# Altium schematic sheet QuickSwitchV5.SchDoc
size 420 x 297 mm; SheetNumber: 1; SheetTotal: 1
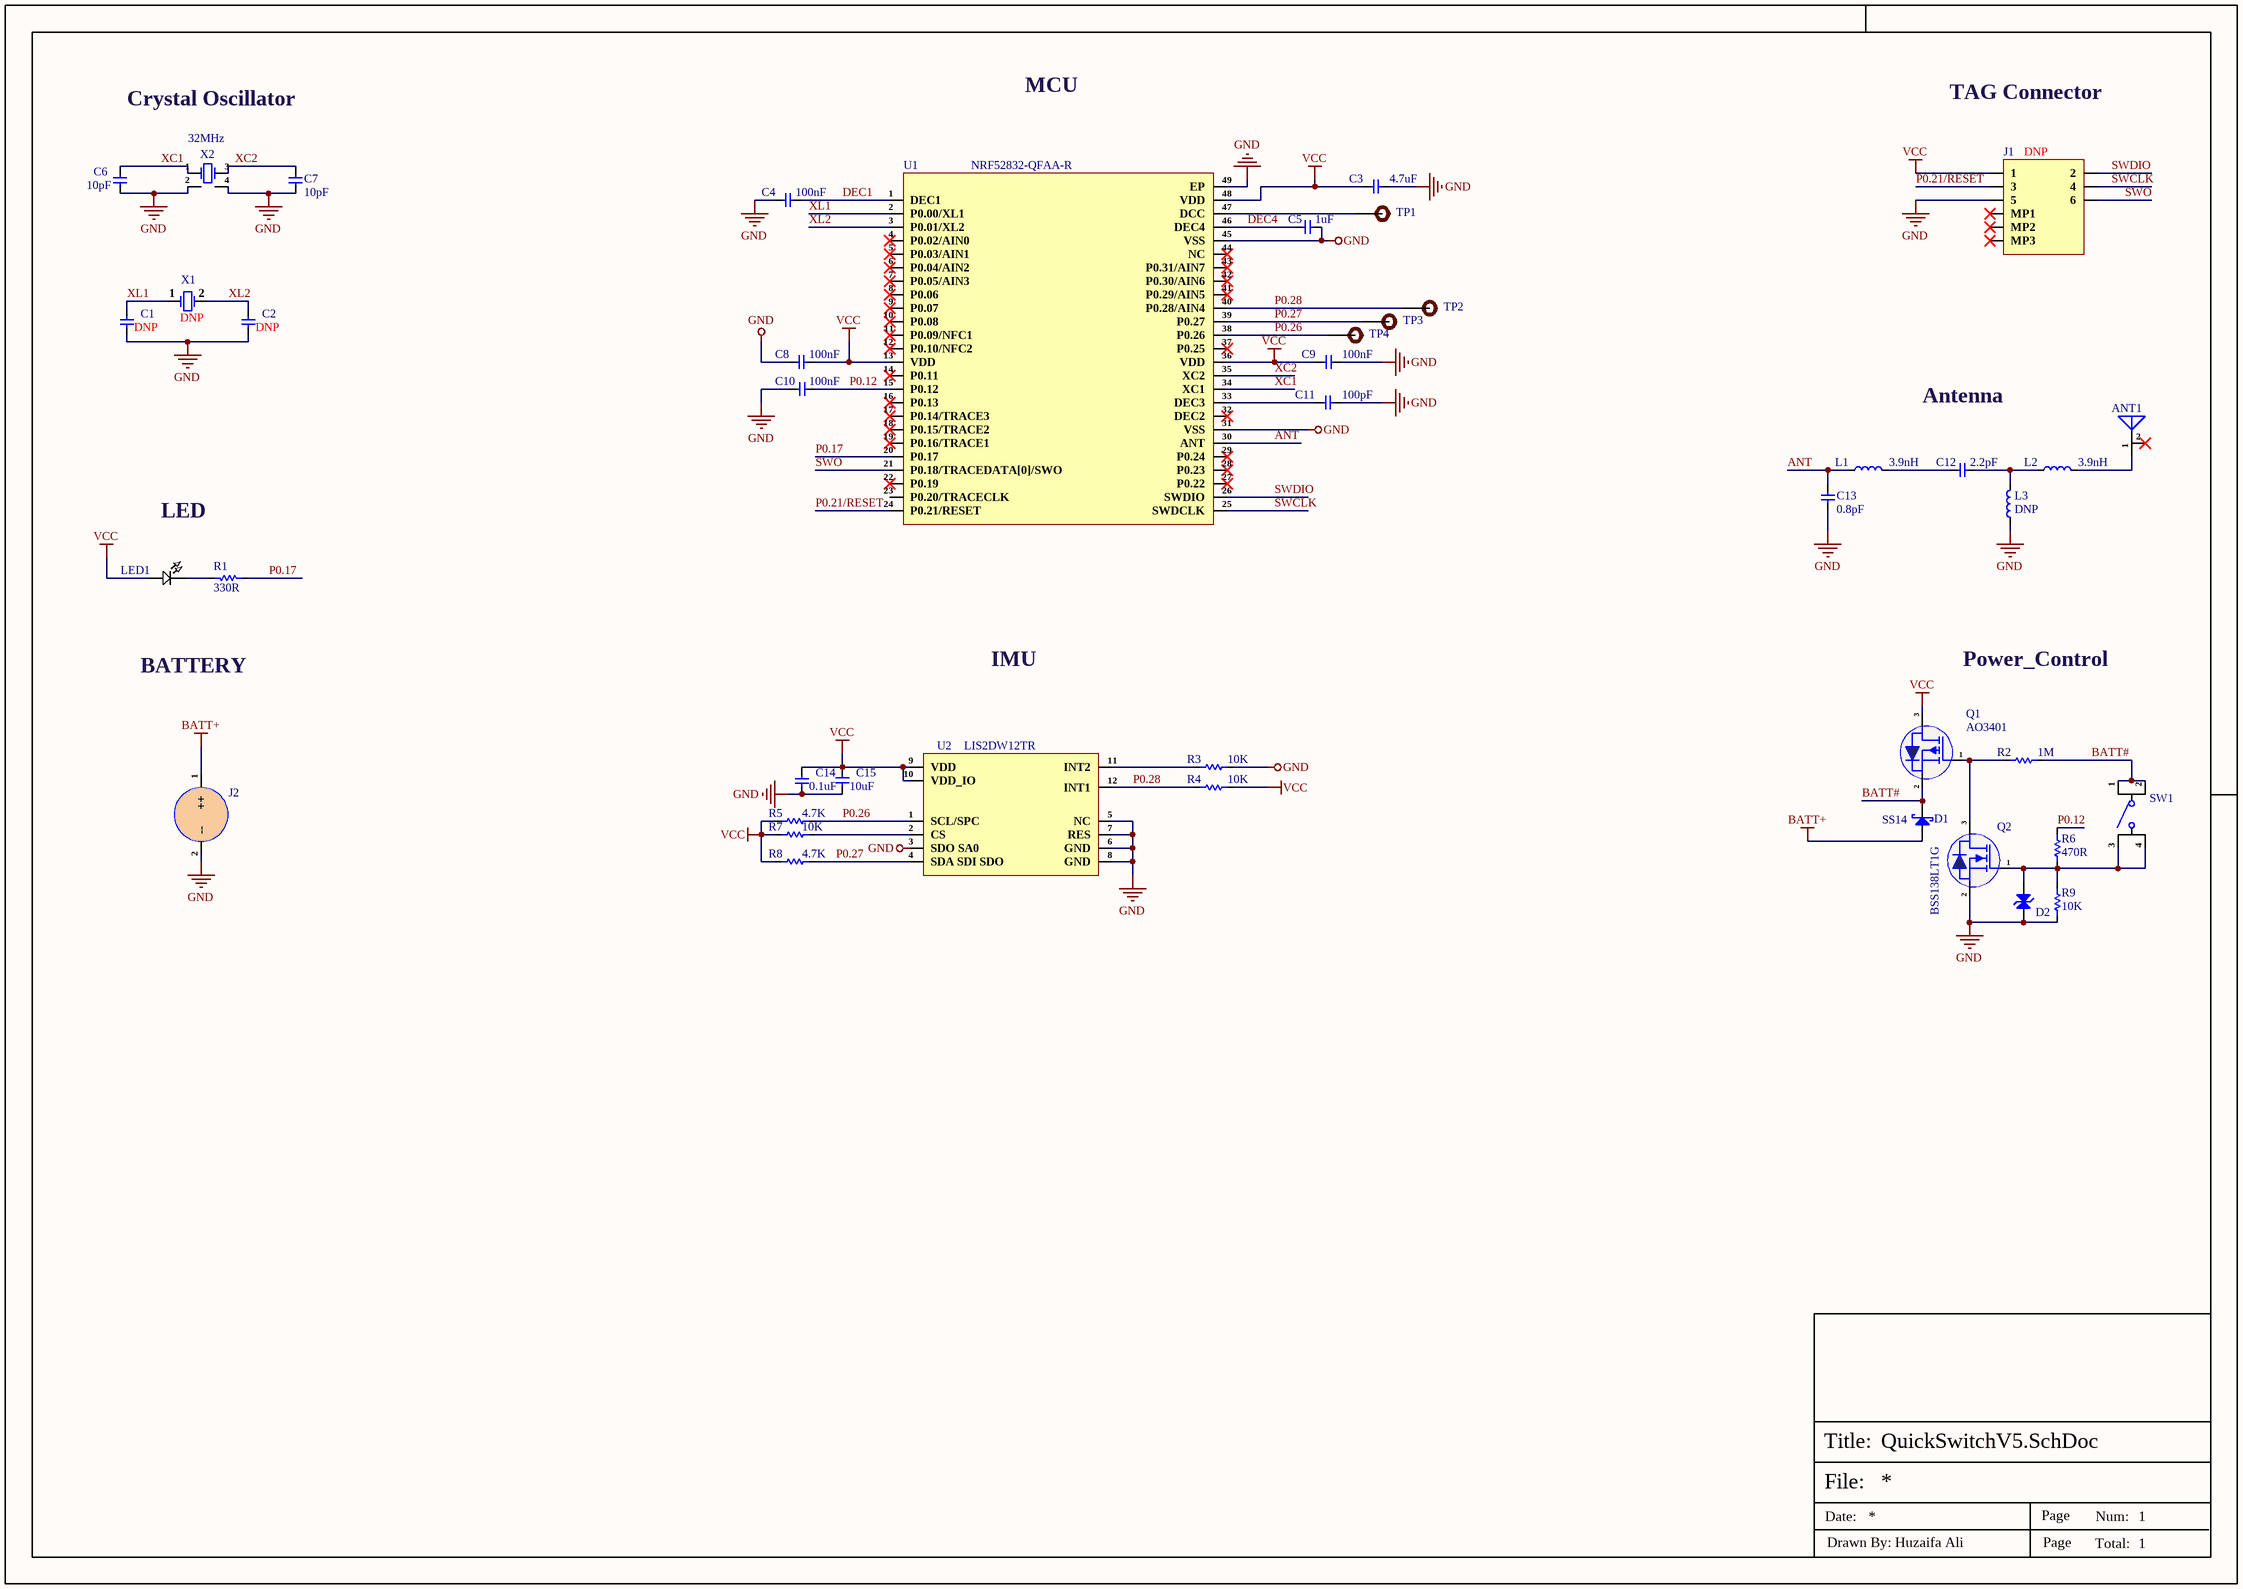
[diagram p0: QuickSwitchV5.SchDoc]

## Parts
ANT1  2450AT18B100E  [ANT-1206]  (value not drawn)
C1  DNP  [Cap-0402]
C2  DNP  [Cap-0402]
C3  4.7uF  [Cap-0603]
C4  100nF  [cap-0402]
C5  1uF  [Cap-0402]
C6  10pF  [Cap-0402]
C7  10pF  [Cap-0402]
C8  100nF  [cap-0402]
C9  100nF  [cap-0402]
C10  100nF  [cap-0402]
C11  100pF  [Cap-0402]
C12  2.2pF  [Cap-0402]
C13  0.8pF  [Cap-0402]
C14  0.1uF  [Cap-0603]
C15  10uF  [Cap-0603]
D1  SS14  [SMA(DO-214AC)]
D2  ESD9B3.3ST5G-ES  [SOD-923.]  (value not drawn)
J1  DNP  [TC2030-IDC-NL_]
J2  CR2032-BS-6-1  [CR2032-BS-6-1]  (value not drawn)
L1  3.9nH  [IND-0201]
L2  3.9nH  [IND-0201]
L3  DNP  [IND-0201]
LED1  XL-1608UBC-04  [LED-0603]  (value not drawn)
Q1  AO3401  [SOT-23]
Q2  BSS138LT1G  [SOT-23]
R1  330R  [Res-0603]
R2  1M  [Res-0603]
R3  10K  [Res-0402]
R4  10K  [Res-0402]
R5  4.7K  [Res-0402]
R6  470R  [Res-0603]
R7  10K  [Res-0402]
R8  4.7K  [Res-0402]
R9  10K  [Res-0402]
SW1  TS-1187A-B-A-B  [TS-1187A-B-A-B]  (value not drawn)
TP1  TEST POINT 0.5mm Dia  [Test-point - 0.5mm]  (value not drawn)  (no BOM)
TP2  TEST POINT 0.5mm Dia  [Test-point - 0.5mm]  (value not drawn)  (no BOM)
TP3  TEST POINT 0.5mm Dia  [Test-point - 0.5mm]  (value not drawn)  (no BOM)
TP4  TEST POINT 0.5mm Dia  [Test-point - 0.5mm]  (value not drawn)  (no BOM)
U1  NRF52832-QFAA-R  [QFN-48-EP(6x6)]
U2  LIS2DW12TR  [12-LGA (2x2)]
X1  DNP  [SMD3215-2P]
X2  32MHz  [SMD2016-4P]

## Nets
BATT+: D1.2(A) J2.1(++)
GND: C1.1 C2.1 C3.1 C4.1 C5.2 C6.1 C7.1 C8.1 C9.1 C10.2 C11.2 C13.1 C14.1 C15.2 D2.1(A) J1.5 J2.2(--) L3.1 Q2.2(S) R3.1 R9.1 U1.31(VSS) U1.45(VSS) U1.49(EP) U2.3(SDO_SA0) U2.5(NC) U2.6(GND) U2.7(RES) U2.8(GND) X2.2(GND) X2.4(GND)
VCC: C3.2 C8.2 C9.2 C14.2 C15.1 J1.1 LED1.1 Q1.3(D) R4.1 R5.1 R7.2 R8.1 U1.13(VDD) U1.36(VDD) U1.48(VDD) U2.9(VDD) U2.10(VDD_IO)
ANT: C13.2 L1.1 U1.30(ANT)
BATT#: D1.1(K) Q1.2(S) R2.2 SW1.1 SW1.2
DEC1: C4.2 U1.1(DEC1)
DEC4: C5.1 U1.46(DEC4)
P0.12: C10.1 R6.2 U1.15(P0.12)
P0.17: R1.1 U1.20(P0.17)
P0.21/RESET: J1.3 U1.24(P0.21/RESET)
P0.26: R5.2 TP4.1 U1.38(P0.26) U2.1(SCL/SPC)
P0.27: R8.2 TP3.1 U1.39(P0.27) U2.4(SDA_SDI_SDO)
P0.28: R4.2 TP2.1 U1.40(P0.28/AIN4) U2.12(INT1)
SWCLK: J1.4 U1.25(SWDCLK)
SWDIO: J1.2 U1.26(SWDIO)
SWO: J1.6 U1.21(P0.18/TRACEDATA[0]/SWO)
XC1: C6.2 U1.34(XC1) X2.1(OSC1)
XC2: C7.2 U1.35(XC2) X2.3(OSC2)
XL1: C1.2 U1.2(P0.00/XL1) X1.1(OSC1)
XL2: C2.2 U1.3(P0.01/XL2) X1.2(OSC2)
NetANT1_1: ANT1.1(FEED) L2.2
NetC11_1: C11.1 U1.33(DEC3)
NetC12_1: C12.1 L1.2
NetC12_2: C12.2 L2.1 L3.2
NetD2_2: D2.2(A) Q2.1(G) R6.1 R9.2 SW1.3 SW1.4
NetLED1_2: LED1.2 R1.2
NetQ1_1: Q1.1(G) Q2.3(D) R2.1
NetR3_2: R3.2 U2.11(INT2)
NetR7_1: R7.1 U2.2(CS)
NetTP1_1: TP1.1 U1.47(DCC)

Not connected (* = marked no-connect by the designer): ANT1 2(NC)*; J1 MP1* MP2* MP3*; U1 4(P0.02/AIN0)* 5(P0.03/AIN1)* 6(P0.04/AIN2)* 7(P0.05/AIN3)* 8(P0.06)* 9(P0.07)* 10(P0.08)* 11(P0.09/NFC1)* 12(P0.10/NFC2)* 14(P0.11)* 16(P0.13)* 17(P0.14/TRACE3)* 18(P0.15/TRACE2)* 19(P0.16/TRACE1)* 22(P0.19)* 23(P0.20/TRACECLK) 27(P0.22)* 28(P0.23)* 29(P0.24)* 32(DEC2)* 37(P0.25)* 41(P0.29/AIN5)* 42(P0.30/AIN6)* 43(P0.31/AIN7)* 44(NC)*

## Notes on the sheet
- Crystal Oscillator
- MCU
- TAG Connector
- Antenna
- LED
- IMU
- Power_Control
- BATTERY
- File:
- Title:
- Date:
- Page
- Num:
- Total:
- Drawn By: Huzaifa Ali

## Library data of the parts
ANT1 = 2450AT18B100E: RF ANT 2.4GHZ CHIP SOLDER SMD; Manufacturer: Johanson; Supplier: Arrow Electronics; Supplier Part Number: 2450AT18B100E; Manufacturer Part Number: 2450AT18B100E; RoHS: Yes; Category: RF Antennas; Stock: 792000; Pricing: 3000=0.3724, 6000=0.3688, 9000=0.3651, 12000=0.3615, 15000=0.3579, 30000=0.3542 (USD); ComponentLink1URL: https://datasheet.ciiva.com/24025/antenna-2450at18b100-242422-24025839.pdf?src-supplier=Mouser; ComponentLink1Description: https://datasheet.ciiva.com/24025/antenna-2450at18b100-242422-24025839.pdf?src-supplier=Mouser; ComponentLink2URL: https://datasheet.ciiva.com/1124/1318299-1124918.pdf?src-supplier=Element14; ComponentLink2Description: https://datasheet.ciiva.com/1124/1318299-1124918.pdf?src-supplier=Element14
C1 C2 = CC0402FRNPO9BN130: CAP CER 13PF 50V C0G/NP0 0402; Manufacturer: Yageo; Item Type: Capacitors; Supplier: Digikey; LCSC Part Number: C541433; Manufacturer Part Number: CC0402FRNPO9BN130; RoHS: No; Pricing: 10000=0.00937 (USD)
C3 = GRM188R61E475KE11D: CAP CER 4.7UF 25V X5R 0603; Manufacturer: Murata; Material: Ceramic; Tolerance: 10%; Supplier 1: Digi-Key; Manufacturer Part Number: GRM188R61E475KE11D; Stock 1: 71618; Pricing 1: 1=0.37, 10=0.258, 100=0.1549, 500=0.1162, 1000=0.09812 (USD); Mount: Surface Mount; Case/Package: 0603; Case Code (Metric): 1608; Case Code (Imperial): 0603; Min Operating Temperature: -55°C; Max Operating Temperature: 85°C; Package Quantity: 4000; Packaging: Cut Tape; Capacitance: 4.7uF; Voltage Rating: 25V; Dielectric: X5R; Voltage: 25V; Voltage Rating (DC): 25V; Length: 1.6mm; Height: 0.8mm; Width: 0.031inch; Thickness: 0.031inch; Depth: 0.8mm; REACH SVHC: No SVHC; Lead Free: Lead Free; ComponentLink1URL: http://www.farnell.com/datasheets/2048165.pdf?src-supplier=Element14; ComponentLink1Description: http://www.farnell.com/datasheets/2048165.pdf?src-supplier=Element14; ComponentLink2URL: https://www.murata.com/~/media/webrenewal/support/library/catalog/products/capacitor/mlcc/c02e.ashx?la=en-us&src-supplier=Digi-Key; ComponentLink2Description: https://www.murata.com/~/media/webrenewal/support/library/catalog/products/capacitor/mlcc/c02e.ashx?la=en-us&src-supplier=Digi-Key; Supplier Part Number 1: 490-7203-1-ND; LCSC Part Number: C90057
C4 C8-C10 = C1005X7R1H104KT000F: CAP CER 0.1UF 50V X7R 0402; Manufacturer: TDK; Tolerance: 10%; Voltage: 25V; Item Type: Capacitor; Supplier 1: Avnet; Manufacturer Part Number: C1005X7R1H104KT000F; RoHS: No; Category: Ceramic Capacitors; Dielectric: X7R; Supplier Part Number 1: C1005X7R1H104KT000F; LCSC Part Number: C361198; ComponentLink1Description: LCSC; ComponentLink1URL: https://www.lcsc.com/product-detail/Multilayer-Ceramic-Capacitors-MLCC-SMD-SMT_TDK-C1005X7R1H104KT000F_C361198.html
C5 = CC0402KRX5R7BB105: CAP CER 1UF 16V X5R 0402; Manufacturer: Yageo; Tolerance: 10%; Item Type: Capacitor; Supplier 1: Digi-Key; Manufacturer Part Number: CC0402KRX5R7BB105; Stock 1: 1405667; Pricing 1: 1=0.36, 10=0.252, 100=0.1512, 500=0.1134, 1000=0.09576, 2500=0.09072, 5000=0.08568 (USD); Mount: Surface Mount; Case/Package: 0402; Weight: 2.3E-05oz; Case Code (Imperial): 0402; Case Code (Metric): 1005; Min Operating Temperature: -55°C; Max Operating Temperature: 85°C; Capacitance: 1uF; Dielectric: X5R; Packaging: Tape and Reel; Voltage Rating (DC): 16V; Voltage Rating: 16V; Termination: SMD/SMT; Composition: Ceramic; Length: 1mm; Height: 0.5mm; Width: 0.02inch; Thickness: 0.022inch; Depth: 0.5mm; Radiation Hardening: No; Lead Free: Lead Free; Halogen Free: Halogen Free; ComponentLink1URL: http://www.yageo.com/documents/recent/UPY-GPHC_X5R_4V-to-50V_12.pdf?src-supplier=Avnet+Europe; ComponentLink1Description: http://www.yageo.com/documents/recent/UPY-GPHC_X5R_4V-to-50V_12.pdf?src-supplier=Avnet+Europe; Supplier Part Number 1: 311-1691-6-ND; LCSC Part Number: C325464
C6 C7 = GRM1555C1H100JA01D: CAP CER 10PF 50V C0G/NP0 0402; Manufacturer: Murata; Material: Ceramic; Dielectric: C0G; Tolerance: 5%; Item Type: Capacitor; Supplier: Arrow Electronics; Supplier Part Number: GRM1555C1H100JA01D; Manufacturer Part Number: GRM1555C1H100JA01D; RoHS: Yes; Category: Ceramic Capacitors; Stock: 3860000; Pricing: 10000=0.0034, 50000=0.0027, 100000=0.0023, 250000=0.0021 (USD); Mounting Technology: Surface Mount; Case/Package: 0402; Case Code (Metric): 1005; Case Code (Imperial): 0402; Min Operating Temperature: -55°C; Max Operating Temperature: 125°C; Value: 10pF; Voltage Rating: 50V; Packaging: Tape and Reel; Package Quantity: 1; Voltage Rating (DC): 50V; Termination: SMD/SMT; Series: GRM; Voltage: 50V; Construction: Flat; Length: 1mm; Width: 0.02inch; Height: 0.5mm; Depth: 0.5mm; Thickness: 0.022inch; Radiation Hardening: No; RoHS Compliant: Yes; Lead Free: Lead Free; Reach SVHC Compliant: No; ComponentLink1URL: https://datasheet.ciiva.com/2989/product-2989280.pdf?src-supplier=Avnet; ComponentLink1Description: https://datasheet.ciiva.com/2989/product-2989280.pdf?src-supplier=Avnet; ComponentLink2URL: https://datasheet.ciiva.com/18184/getdatasheetpartid-307234-18184164.pdf?src-supplier=Verical; ComponentLink2Description: https://datasheet.ciiva.com/18184/getdatasheetpartid-307234-18184164.pdf?src-supplier=Verical; ComponentLink3URL: https://datasheet.ciiva.com/29200/453545-da-01-en-vs-kondensator-0402-29200107.pdf?src-supplier=Conrad; ComponentLink3Description: https://datasheet.ciiva.com/29200/453545-da-01-en-vs-kondensator-0402-29200107.pdf?src-supplier=Conrad; ComponentLink4URL: https://datasheet.ciiva.com/7828/1666664-7828812.pdf?src-supplier=Element14; ComponentLink4Description: https://datasheet.ciiva.com/7828/1666664-7828812.pdf?src-supplier=Element14; ComponentLink5URL: https://datasheet.ciiva.com/6271/partnumbering-e-01-6271159.pdf?src-supplier=Digi-Key; ComponentLink5Description: https://datasheet.ciiva.com/6271/partnumbering-e-01-6271159.pdf?src-supplier=Digi-Key; ComponentLink6URL: https://datasheet.ciiva.com/6271/partnumbering-e-01-6271158.pdf?src-supplier=Digi-Key; ComponentLink6Description: https://datasheet.ciiva.com/6271/partnumbering-e-01-6271158.pdf?src-supplier=Digi-Key; ComponentLink7URL: https://datasheet.ciiva.com/6271/partnumbering-e-01-6271068.pdf?src-supplier=Digi-Key; ComponentLink7Description: https://datasheet.ciiva.com/6271/partnumbering-e-01-6271068.pdf?src-supplier=Digi-Key; LCSC Part Number: C76946
C11 = 04025A101JAT2A: CAP CER 100PF 50V C0G/NP0 0402; Manufacturer: Kyocera AVX; Tolerance: 5%; Dielectric: C0G; Insulation Resistance: 1GR; Temperature Coefficient: 30ppm/°C; Dissipation Factor: 2.5%; Item Type: Capacitor; Supplier 1: Avnet; Manufacturer Part Number: 04025A101JAT2A; RoHS: Yes; Category: Ceramic Capacitors; Stock 1: 3437500; Pricing 1: 10000=0.10788, 20000=0.10540, 40000=0.10292, 60000=0.10044, 80000=0.09796, 100000=0.09548, 1000000=0.09424 (USD); Mount: Surface Mount,PCB; Case/Package: 0402; Case Code (Metric): 1005; Case Code (Imperial): 0402; Contact Plating: Tin,Matte; Min Operating Temperature: -55°C; Max Operating Temperature: 125°C; Capacitance: 100pF; Voltage Rating (DC): 50V; Packaging: Tape and Reel; Voltage Rating: 50V; Package Quantity: 10000; Termination: SMD/SMT; Voltage: 50V; Series: -; Construction: Flat; Length: 1mm; Width: 0.004inch; Height: 0.56mm; Thickness: 0.013inch; Depth: 0.5mm; Radiation Hardening: No; Reach SVHC Compliant: Yes; Lead Free: Lead Free; RoHS Compliant: Yes; ComponentLink1URL: https://datasheet.ciiva.com/11786/0900766b80def0e2-11786618.pdf?src-supplier=RSComponents; ComponentLink1Description: https://datasheet.ciiva.com/11786/0900766b80def0e2-11786618.pdf?src-supplier=RSComponents; ComponentLink2URL: https://datasheet.ciiva.com/1123/493359-1123473.pdf?src-supplier=Element14; ComponentLink2Description: https://datasheet.ciiva.com/1123/493359-1123473.pdf?src-supplier=Element14; ComponentLink3URL: https://datasheet.ciiva.com/1123/493359-1123474.pdf?src-supplier=Element14; ComponentLink3Description: https://datasheet.ciiva.com/1123/493359-1123474.pdf?src-supplier=Element14; ComponentLink4URL: https://datasheet.ciiva.com/16332/ccog-16332501.pdf?src-supplier=Future+Electronics; ComponentLink4Description: https://datasheet.ciiva.com/16332/ccog-16332501.pdf?src-supplier=Future+Electronics; ComponentLink5URL: https://datasheet.ciiva.com/46392/759117-46392007.pdf?src-supplier=Element14; ComponentLink5Description: https://datasheet.ciiva.com/46392/759117-46392007.pdf?src-supplier=Element14; ComponentLink6URL: https://datasheet.ciiva.com/150/ccog-150473.pdf?src-supplier=Digi-Key; ComponentLink6Description: https://datasheet.ciiva.com/150/ccog-150473.pdf?src-supplier=Digi-Key; ComponentLink7URL: https://datasheet.ciiva.com/150/ccog-150474.pdf?src-supplier=Digi-Key; ComponentLink7Description: https://datasheet.ciiva.com/150/ccog-150474.pdf?src-supplier=Digi-Key; ComponentLink8URL: https://datasheet.ciiva.com/2987/ccog-2987642.pdf?src-supplier=Avnet; ComponentLink8Description: https://datasheet.ciiva.com/2987/ccog-2987642.pdf?src-supplier=Avnet; ComponentLink9URL: https://datasheet.ciiva.com/150/ccog-150475.pdf?src-supplier=Digi-Key; ComponentLink9Description: https://datasheet.ciiva.com/150/ccog-150475.pdf?src-supplier=Digi-Key; ComponentLink10URL: https://datasheet.ciiva.com/8083/ccog-8083054.pdf?src-supplier=Avnet; ComponentLink10Description: https://datasheet.ciiva.com/8083/ccog-8083054.pdf?src-supplier=Avnet; ComponentLink11URL: https://datasheet.ciiva.com/5413/ccog-5413647.pdf?src-supplier=Mouser; ComponentLink11Description: https://datasheet.ciiva.com/5413/ccog-5413647.pdf?src-supplier=Mouser; Supplier Part Number 1: 04025A101JAT2A; LCSC Part Number: C597014
C12 = GRM1555C1H2R2BA01D: CAP CER 2.2PF 50V C0G/NP0 0402; Manufacturer: Murata; Material: Ceramic; Dielectric: C0G; Temperature Coefficient: 30ppm/°C; Item Type: Capacitor; Supplier: Avnet; Supplier Part Number: GRM1555C1H2R2BA01D; Manufacturer Part Number: GRM1555C1H2R2BA01D; RoHS: Yes; Category: Ceramic Capacitors; Stock: 110000; Pricing: 10000=0.00887, 20000=0.00867, 40000=0.00847 (USD); Mounting Technology: Surface Mount; Case/Package: 0402; Case Code (Imperial): 0402; Case Code (Metric): 1005; Min Operating Temperature: -55°C; Max Operating Temperature: 125°C; Value: 2.2pF; Packaging: Tape and Reel; Package Quantity: 1; Termination: SMD/SMT; Series: GRM; Voltage Rating: 50V; Voltage Rating (DC): 50V; Voltage: 50V; Construction: Flat; Length: 1mm; Width: 0.5mm; Height: 0.5mm; Thickness: 0.022inch; Depth: 0.5mm; Radiation Hardening: No; Reach SVHC Compliant: No; RoHS Compliant: Yes; Lead Free: Lead Free; ComponentLink1URL: https://datasheet.ciiva.com/6270/grm1555c1h2r1wa01-01-6270869.pdf?src-supplier=Digi-Key; ComponentLink1Description: https://datasheet.ciiva.com/6270/grm1555c1h2r1wa01-01-6270869.pdf?src-supplier=Digi-Key; ComponentLink2URL: https://datasheet.ciiva.com/18184/getdatasheetpartid-316203-18184296.pdf?src-supplier=Verical; ComponentLink2Description: https://datasheet.ciiva.com/18184/getdatasheetpartid-316203-18184296.pdf?src-supplier=Verical; ComponentLink3URL: https://datasheet.ciiva.com/16440/c02e-16440539.pdf?src-supplier=Future+Electronics; ComponentLink3Description: https://datasheet.ciiva.com/16440/c02e-16440539.pdf?src-supplier=Future+Electronics; ComponentLink4URL: https://datasheet.ciiva.com/6270/partnumbering-e-01-6270873.pdf?src-supplier=Digi-Key; ComponentLink4Description: https://datasheet.ciiva.com/6270/partnumbering-e-01-6270873.pdf?src-supplier=Digi-Key; ComponentLink5URL: https://datasheet.ciiva.com/6270/partnumbering-e-01-6270877.pdf?src-supplier=Digi-Key; ComponentLink5Description: https://datasheet.ciiva.com/6270/partnumbering-e-01-6270877.pdf?src-supplier=Digi-Key; ComponentLink6URL: https://datasheet.ciiva.com/11615/product-11615030.pdf?src-supplier=Avnet; ComponentLink6Description: https://datasheet.ciiva.com/11615/product-11615030.pdf?src-supplier=Avnet; LCSC Part Number: C88927
C13 = CC0402BRNPO9BNR80: CAP CER 0.8PF 50V C0G/NPO 0402; Manufacturer: Yageo; Dielectric: C0G; Item Type: Capacitor; Supplier: Future Electronics; Supplier Part Number: 4783825; Manufacturer Part Number: CC0402BRNPO9BNR80; RoHS: Yes; Category: Ceramic Capacitors; Stock: 70000; Pricing: 10000=0.0034, 40000=0.0032, 150000=0.0031, 250000=0.003, 500000=0.0028 (USD); Mounting Technology: Surface Mount; Case/Package: 0402; Case Code (Imperial): 0402; Case Code (Metric): 1005; Weight: 2.3E-05oz; Min Operating Temperature: -55°C; Max Operating Temperature: 125°C; Value: 0.8pF; Voltage Rating (DC): 50V; Packaging: Tape and Reel; Termination: SMD/SMT; Voltage Rating: 50V; Series: CC; Length: 0.039inch; Width: 0.02inch; Thickness: 0.022inch; RoHS Compliant: Yes; Halogen Free: 5694HalogenFree; Lead Free: 5697LeadFree; ComponentLink1URL: http://www.mouser.com/ds/2/447/Yageo_UPY-GP_NP0_16V-to-50V_9-358835.pdf?src-supplier=Mouser; ComponentLink1Description: http://www.mouser.com/ds/2/447/Yageo_UPY-GP_NP0_16V-to-50V_9-358835.pdf?src-supplier=Mouser; ComponentLink2URL: https://datasheet.octopart.com/CC0402BRNPO9BNR80-Yageo-datasheet-151948684.pdf?src-supplier=Newark; ComponentLink2Description: https://datasheet.octopart.com/CC0402BRNPO9BNR80-Yageo-datasheet-151948684.pdf?src-supplier=Newark; ComponentLink3URL: http://www.yageo.com/documents/recent/UPY-GP_NP0_16V-to-50V_16.pdf?src-supplier=Digikey; ComponentLink3Description: http://www.yageo.com/documents/recent/UPY-GP_NP0_16V-to-50V_16.pdf?src-supplier=Digikey; ComponentLink4URL: https://www.yageo.com/upload/media/product/productsearch/datasheet/mlcc/UPY-GP_NP0_16V-to-50V_18.pdf?src-supplier=Digikey; ComponentLink4Description: https://www.yageo.com/upload/media/product/productsearch/datasheet/mlcc/UPY-GP_NP0_16V-to-50V_18.pdf?src-supplier=Digikey; ComponentLink5URL: https://datasheet.octopart.com/CC0402BRNPO9BNR80-Yageo-datasheet-151948684.pdf?src-supplier=Farnell; ComponentLink5Description: https://datasheet.octopart.com/CC0402BRNPO9BNR80-Yageo-datasheet-151948684.pdf?src-supplier=Farnell; ComponentLink6URL: https://datasheet.octopart.com/CC0402BRNPO9BNR80-Yageo-datasheet-137875056.pdf?src-supplier=Future+Electronics; ComponentLink6Description: https://datasheet.octopart.com/CC0402BRNPO9BNR80-Yageo-datasheet-137875056.pdf?src-supplier=Future+Electronics; LCSC Part Number: C327032
C14 = CC0603ZRY5V9BB104: CAP CER 0.1UF 50V Y5V 0603; Manufacturer: Yageo; Capacitance: 100nF; Tolerance: 80%; Item Type: Capacitor; Supplier 1: Digi-Key; Manufacturer Part Number: CC0603ZRY5V9BB104; Stock 1: 15000880; Pricing 1: 1=0.1, 10=0.075, 100=0.0334, 500=0.02386, 1000=0.01874 (USD); Mount: Surface Mount; Case/Package: 0603; Number of Pins: 2; Case Code (Metric): 1608; Case Code (Imperial): 0603; Min Operating Temperature: -30°C; Max Operating Temperature: 85°C; Dielectric: Y5V; Voltage Rating: 50V; Package Quantity: 1; Packaging: Tape and Reel; Voltage Rating (DC): 50V; Termination: SMD/SMT; Composition: Ceramic; Voltage: 50V; Length: 1.6mm; Height: 0.8mm; Width: 0.031inch; Thickness: 0.035inch; Depth: 0.8mm; Radiation Hardening: No; REACH SVHC: No SVHC; Lead Free: Lead Free; Halogen Free: Halogen Free; ComponentLink1URL: http://www.yageo.com/documents/recent/UPY-GPHC_Y5V_6.3V-to-50V_8.pdf?src-supplier=Digi-Key; ComponentLink1Description: http://www.yageo.com/documents/recent/UPY-GPHC_Y5V_6.3V-to-50V_8.pdf?src-supplier=Digi-Key; ComponentLink2URL: http://www.yageo.com/documents/recent/UPY-GPHC_Y5V_6.3V-to-50V_5.pdf?src-supplier=Avnet+Europe; ComponentLink2Description: http://www.yageo.com/documents/recent/UPY-GPHC_Y5V_6.3V-to-50V_5.pdf?src-supplier=Avnet+Europe; ComponentLink3URL: https://www.verical.com/server-webapp/html/getDatasheet?partID=403611&src-supplier=Verical; ComponentLink3Description: https://www.verical.com/server-webapp/html/getDatasheet?partID=403611&src-supplier=Verical; ComponentLink4URL: http://www.mouser.com/ds/2/447/Yageo_UPY-GP_NP0_16V-to-50V_9-358835.pdf?src-supplier=Mouser; ComponentLink4Description: http://www.mouser.com/ds/2/447/Yageo_UPY-GP_NP0_16V-to-50V_9-358835.pdf?src-supplier=Mouser; ComponentLink5URL: http://www.farnell.com/datasheets/1132289.pdf?src-supplier=Element14; ComponentLink5Description: http://www.farnell.com/datasheets/1132289.pdf?src-supplier=Element14; Supplier Part Number 1: 311-1343-1-ND; LCSC Part Number: C106221
C15 = CGA0603X5R106K100JT: 10V 10uF X5R ±10% 0603 Multilayer Ceramic Capacitors MLCC - SMD/SMT ROHS; Manufacturer: HRE; ComponentLink1Description: LCSC; ComponentLink1URL: https://www.lcsc.com/product-detail/Multilayer-Ceramic-Capacitors-MLCC-SMD-SMT_HRE-CGA0603X5R106K100JT_C6119842.html; Manufacturer Part Number: CGA0603X5R106K100JT; Package: 0603; LCSC Part Number: C6119842; Item Type: Capacitor
D1 = SS14: 40V Independent Type 1A 550mV@1A SMA(DO-214AC) Schottky Diodes ROHS; Manufacturer: MDD(Microdiode Semiconductor); Item Type: Diode; Manufacturer Part Number: SS14; Package: SMA(DO-214AC); LCSC Part Number: C2480; ComponentLink1Description: LCSC; ComponentLink1URL: https://www.lcsc.com/product-detail/Schottky-Diodes_MDD-Microdiode-Semiconductor-SS14_C2480.html?s_z=n_C2480
D2 = ESD9B3.3ST5G-ES: 6A 80W 10V 3.7V Bidirectional 3.3V SOD-923 ESD and Surge Protection (TVS/ESD) ROHS; Manufacturer: ElecSuper; Item Type: Diode; Manufacturer Part Number: ESD9B3.3ST5G-ES; Package: SOD-923; LCSC Part Number: C5180230; ComponentLink1Description: LCSC; ComponentLink1URL: https://www.lcsc.com/product-detail/ESD-and-Surge-Protection-TVS-ESD_ElecSuper-ESD9B3-3ST5G-ES_C5180230.html?s_z=n_C5180230
J1 = TC2030-IDC-NL
J2 = CR2032-BS-6-1: Battery base CR2032 SMD Battery Connectors ROHS; Manufacturer: Q&J; Manufacturer Part Number: CR2032-BS-6-1; LCSC Part Number: C70377; Item Type: Connector; ComponentLink1Description: LCSC; ComponentLink1URL: https://www.lcsc.com/product-detail/Battery-Connectors_Q-J-CR2032-BS-6-1_C70377.html
L1 L2 = LQP03TG3N9B02D: FIXED IND 3.9NH 350MA 350MOHM SM; Manufacturer: Murata; Item Type: Inductors; Shielding: Unshielded; DC Resistance (DCR): 350mR; Self Resonant Frequency: 6GHz; Test Frequency: 500MHz; Supplier: Digikey; LCSC Part Number: C86114; Manufacturer Part Number: LQP03TG3N9B02D; RoHS: Yes; Stock: 170; Pricing: 1=0.1, 10=0.025, 25=0.0224, 50=0.0208, 100=0.0193, 250=0.01748, 500=0.0162, 1000=0.01502, 2500=0.01358 (USD); Mounting Technology: Surface Mount; Case/Package: 0201; Min Operating Temperature: -55°C; Max Operating Temperature: 125°C; Package Quantity: 15000; Packaging: Tape and Reel; Current Rating: 350mA; Value: 3.9nH; Max DC Current: 350mA; DC Current: 350mA; Series: LQP03TG_02; Technology: THIN FILM; Length: 0.024inch; Width: 0.012inch; Height: 0.3mm; Height - Seated (Max): 0.013inch; Depth: 0.33mm; Military Standard: Not; RoHS Compliant: Yes; ComponentLink1URL: https://datasheet.ciiva.com/29691/jelf243c-0016-29691349.pdf?src-supplier=Digikey; ComponentLink1Description: https://datasheet.ciiva.com/29691/jelf243c-0016-29691349.pdf?src-supplier=Digikey
L3 = LQP03TN2N7B02D: FIXED IND 2.7NH 500MA 200MOHM SM; Manufacturer: Murata; Core Material: Non-Magnetic; Self Resonant Frequency: 6GHz; Tolerance: 3%; Shielding: Unshielded; DC Resistance (DCR): 200mR; Q Factor: 14; Current: 350mA; Test Frequency: 500MHz; Item Type: Inductor; Supplier 1: Rs; Manufacturer Part Number: LQP03TN2N7B02D; RoHS: Yes; Category: Fixed Inductors; Stock 1: 4000; Pricing 1: 200=0.007 (GBP); Mount: Surface Mount; Case/Package: 0201; Case Code (Metric): 0603; Case Code (Imperial): 0201; Min Operating Temperature: -55°C; Max Operating Temperature: 125°C; Packaging: Tape and Reel; Package Quantity: 1; Current Rating: 500mA; Inductance: 2.7nH; Max DC Current: 500mA; Termination: SMD/SMT; DC Current: 500mA; Series: LQP03TN_02; Technology: THIN FILM; Length: 0.024inch; Width: 0.012inch; Height: 0.3mm; Height - Seated (Max): 0.013inch; Depth: 0.33mm; Military Standard: Not; Reach SVHC Compliant: No; Lead Free: Lead Free; RoHS Compliant: Yes; ComponentLink1URL: http://www.farnell.com/datasheets/1888743.pdf?src-supplier=Farnell; ComponentLink1Description: http://www.farnell.com/datasheets/1888743.pdf?src-supplier=Farnell; ComponentLink2URL: http://www.mouser.com/ds/2/281/c51e-794816.pdf?src-supplier=Mouser; ComponentLink2Description: http://www.mouser.com/ds/2/281/c51e-794816.pdf?src-supplier=Mouser; ComponentLink3URL: https://media.digikey.com/pdf/Data%20Sheets/Murata%20PDFs/LQP03_Series_Br.pdf?src-supplier=Digi-Key; ComponentLink3Description: https://media.digikey.com/pdf/Data%20Sheets/Murata%20PDFs/LQP03_Series_Br.pdf?src-supplier=Digi-Key; ComponentLink4URL: http://components.arrow.com/part/dataview/49670632S8721729N2606?src-supplier=Arrow+Electronics; ComponentLink4Description: http://components.arrow.com/part/dataview/49670632S8721729N2606?src-supplier=Arrow+Electronics; ComponentLink5URL: https://datasheet.octopart.com/LQP03TN2N7B02D-Murata-datasheet-26765549.pdf?src-supplier=Future+Electronics; ComponentLink5Description: https://datasheet.octopart.com/LQP03TN2N7B02D-Murata-datasheet-26765549.pdf?src-supplier=Future+Electronics; ComponentLink6URL: http://psearch.en.murata.com/inductor/product/LQP03TN2N7B02%23.pdf?src-supplier=Avnet; ComponentLink6Description: http://psearch.en.murata.com/inductor/product/LQP03TN2N7B02%23.pdf?src-supplier=Avnet; ComponentLink7URL: http://search.murata.co.jp/Ceramy/image/img/w_hinm/S0084E.pdf?src-supplier=Digi-Key; ComponentLink7Description: http://search.murata.co.jp/Ceramy/image/img/w_hinm/S0084E.pdf?src-supplier=Digi-Key; ComponentLink8URL: http://www.farnell.com/datasheets/1888743.pdf?src-supplier=Newark; ComponentLink8Description: http://www.farnell.com/datasheets/1888743.pdf?src-supplier=Newark; ComponentLink9URL: http://www.farnell.com/datasheets/1888743.pdf?src-supplier=Element14; ComponentLink9Description: http://www.farnell.com/datasheets/1888743.pdf?src-supplier=Element14; ComponentLink10URL: https://datasheet.octopart.com/LQP03TN2N7B02D-Murata-datasheet-141404629.pdf?src-supplier=TME; ComponentLink10Description: https://datasheet.octopart.com/LQP03TN2N7B02D-Murata-datasheet-141404629.pdf?src-supplier=TME; Supplier Part Number 1: 1065349; LCSC Part Number: C98043
LED1 = XL-1608UBC-04: 20mA 300mcd Colorless Transparent Lens -20℃~+85℃ Positive Stick 455nm~475nm Blue 120° 70mW 3.3V 0603 LED Indication - Discrete ROHS; Manufacturer: XINGLIGHT; Manufacturer Part Number: XL-1608UBC-04; Package: 0603; LCSC Part Number: C965807; Item Type: LED; ComponentLink1Description: LCSC; ComponentLink1URL: https://www.lcsc.com/product-detail/LED-Indication-Discrete_XINGLIGHT-XL-1608UBC-04_C965807.html?s_z=n_C965807
Q1 = AO3401: Trans Mosfet P-ch 30V 4A 3-PIN SOT-23 T/r; Manufacturer: Alpha & Omega Semiconductor; Manufacturer Part Number: AO3401A; Rds On Max: 44mR; Input Capacitance: 1.2nF; Max Power Dissipation: 1.4W; Number of Elements: 1; Supplier 1: Arrow Electronics; RoHS: Yes; Category: MOSFETs; Mount: Surface Mount; Case/Package: TO-236-3; Number of Pins: 3; Min Operating Temperature: -55°C; Max Operating Temperature: 150°C; Packaging: Tape and Reel; Drain to Source Voltage (Vdss): 30V; Continuous Drain Current (ID): 4A; Power Dissipation: 1.4W; Series: -; Radiation Hardening: No; RoHS Compliant: Yes; Lead Free: Lead Free; ComponentLink1URL: https://datasheet.ciiva.com/940/ao3401a-940720.pdf?src-supplier=Digi-Key; ComponentLink1Description: https://datasheet.ciiva.com/940/ao3401a-940720.pdf?src-supplier=Digi-Key; ComponentLink2URL: https://datasheet.ciiva.com/26927/getdatasheetpartid-79048-26927888.pdf?src-supplier=Verical; ComponentLink2Description: https://datasheet.ciiva.com/26927/getdatasheetpartid-79048-26927888.pdf?src-supplier=Verical; Supplier Part Number 1: AO3401A; LCSC Part Number: C181091; Item Type: Mosfet
Q2 = BSS138LT1G: MOSFET N-CH 50V 200MA SOT-23; Manufacturer: ON Semiconductor; Gate to Source Voltage (Vgs): 20V; Nominal Vgs: 1.5V; Rds On Max: 3.5R; Input Capacitance: 50pF; Number of Elements: 1; Max Power Dissipation: 225mW; Turn-Off Delay Time: 20ns; Element Configuration: Single; ComponentLink1URL: https://datasheet.ciiva.com/22641/1596366-22641636.pdf; ComponentLink1Description: https://datasheet.ciiva.com/22641/1596366-22641636.pdf; ComponentLink2URL: https://datasheet.ciiva.com/1190/1596366-1190137.pdf; ComponentLink2Description: https://datasheet.ciiva.com/1190/1596366-1190137.pdf; ComponentLink3URL: https://datasheet.ciiva.com/15198/getdatasheetpartid-110266-15198908.pdf; ComponentLink3Description: https://datasheet.ciiva.com/15198/getdatasheetpartid-110266-15198908.pdf; ComponentLink4URL: https://datasheet.ciiva.com/8115/bss138lt1-d-8115295.pdf; ComponentLink4Description: https://datasheet.ciiva.com/8115/bss138lt1-d-8115295.pdf; ComponentLink5URL: https://datasheet.ciiva.com/8115/bss138lt1-d-8115358.pdf; ComponentLink5Description: https://datasheet.ciiva.com/8115/bss138lt1-d-8115358.pdf; ComponentLink6URL: https://datasheet.ciiva.com/1190/1596366-1190136.pdf; ComponentLink6Description: https://datasheet.ciiva.com/1190/1596366-1190136.pdf; ComponentLink7URL: https://datasheet.ciiva.com/936/bss138lt1-d-936802.pdf; ComponentLink7Description: https://datasheet.ciiva.com/936/bss138lt1-d-936802.pdf; ComponentLink8URL: https://datasheet.ciiva.com/936/bss138lt1-d-936801.pdf; ComponentLink8Description: https://datasheet.ciiva.com/936/bss138lt1-d-936801.pdf; ComponentLink9URL: https://datasheet.ciiva.com/14553/70099493-14553829.pdf; ComponentLink9Description: https://datasheet.ciiva.com/14553/70099493-14553829.pdf; ComponentLink10URL: https://datasheet.ciiva.com/936/bss138lt1-d-936803.pdf; ComponentLink10Description: https://datasheet.ciiva.com/936/bss138lt1-d-936803.pdf; Supplier 1: Digi-Key; Manufacturer Part Number: BSS138LT1G; Stock 1: 1283212; Pricing 1: 1=0.27, 10=0.222, 100=0.1177, 500=0.07746, 1000=0.05267 (USD); Case/Package: SOT-23-3; Number of Pins: 3; Contact Plating: Tin,Matte; Min Operating Temperature: -55°C; Max Operating Temperature: 150°C; Continuous Drain Current (ID): 200mA; Package Quantity: 1; Packaging: Tape and Reel; Drain to Source Breakdown Voltage: 50V; Power Dissipation: 225mW; Drain to Source Resistance: 3.5R; Threshold Voltage: 1.5V; Turn-On Delay Time: 20ns; Voltage Rating (DC): 50V; Current Rating: 200mA; On-State Resistance: 3.5R; Length: 3.04mm; Height: 1.01mm; Width: 1.4mm; Radiation Hardening: No; REACH SVHC: No SVHC; Lead Free: Lead Free; Halogen Free: Halogen Free; ComponentLink11URL: http://www.onsemi.com/pub/Collateral/BSS138LT1-D.PDF?src-supplier=Digi-Key; ComponentLink11Description: http://www.onsemi.com/pub/Collateral/BSS138LT1-D.PDF?src-supplier=Digi-Key; ComponentLink12URL: http://www.farnell.com/datasheets/1596366.pdf?src-supplier=Element14; ComponentLink12Description: http://www.farnell.com/datasheets/1596366.pdf?src-supplier=Element14; ComponentLink13URL: http://www.alliedelec.com/m/d/b3c6fd7d92596813fe75d33dcbaaae90.pdf?src-supplier=Allied+Electronics; ComponentLink13Description: http://www.alliedelec.com/m/d/b3c6fd7d92596813fe75d33dcbaaae90.pdf?src-supplier=Allied+Electronics; ComponentLink14URL: https://www.verical.com/server-webapp/html/getDatasheet?partID=110266&src-supplier=Verical; ComponentLink14Description: https://www.verical.com/server-webapp/html/getDatasheet?partID=110266&src-supplier=Verical; ComponentLink15URL: http://www.onsemi.com/pub_link/Collateral/BSS138LT1-D.PDF?src-supplier=Avnet; ComponentLink15Description: http://www.onsemi.com/pub_link/Collateral/BSS138LT1-D.PDF?src-supplier=Avnet; Supplier Part Number 1: BSS138LT1GOSDKR-ND; LCSC Part Number: C82045; Item Type: Mosfet
R1 = 0603WAF3300T5E: 100mW Thick Film Resistors 75V ±100ppm/℃ ±1% 330Ω 0603 Chip Resistor - Surface Mount ROHS; Manufacturer: Royal Electronic Factory; Supplier: Mouser; Supplier Part Number: 303-0603WAF3300T5E; Manufacturer Part Number: 0603WAF3300T5E; RoHS: No; Item Type: Resistor; Stock: 210000; Pricing: 10000=0.001 (USD); Value: 330R; LCSC Part Number: C23138
R2 = 0603WAF1004T5E: 100mW Thick Film Resistors ±100ppm/℃ ±1% 1MΩ 0603 Chip Resistor - Surface Mount ROHS; Manufacturer: UNI-ROYAL(Uniroyal Elec); Manfacturer Part Number: 0603WAF1004T5E; LCSC Part Number: C22935; Package: 0603; Item Type: Resistor
R3 R4 R7 R9 = RE0402DRE0710KL: RES SMD 10K OHM 0.5% 1/16W 0402; Manufacturer: Yageo; Value: 10kR; Max Power Dissipation: 63mW; Temperature Coefficient: 50ppm/°C; Item Type: Resistor; Supplier: Future Electronics; Supplier Part Number: 8132697; Manufacturer Part Number: RE0402DRE0710KL; RoHS: Yes; Category: Chip SMD Resistors; Stock: 10000; Pricing: 10000=0.0059, 40000=0.0056, 150000=0.0053, 250000=0.0052, 500000=0.0049 (USD); Case/Package: 0402; Min Operating Temperature: -55°C; Max Operating Temperature: 155°C; Packaging: Tape and Reel; Number of Terminations: 2; Tolerance: 0.5%; Features: Moisture Resistant; Series: RE; Length: 0.039inch; Width: 0.02inch; Height: 0.015inch; RoHS Compliant: Yes; ComponentLink1URL: http://www.yageo.com/NewPortal/yageodocoutput?fileName=/pdf/R-Chip/PYu-RE_105_RoHS_L_6.pdf&src-supplier=Digi-Key; ComponentLink1Description: http://www.yageo.com/NewPortal/yageodocoutput?fileName=/pdf/R-Chip/PYu-RE_105_RoHS_L_6.pdf&src-supplier=Digi-Key; LCSC Part Number: C851874
R5 R8 = RC0402FR-074K7L: RES 4.7K OHM 1% 1/16W 0402; Manufacturer: Yageo; Voltage Rating (DC): 50V; Power Rating: 62.5mW; Resistance: 4.7kR; Temperature Coefficient: 100ppm/°C; Max Power Dissipation: 63mW; Item Type: Resistor; Supplier 1: Avnet; Manufacturer Part Number: RC0402FR-074K7L; RoHS: Yes; Category: Chip SMD Resistors; Stock 1: 2420000; Pricing 1: 10000=0.00085 (USD); Case/Package: 0402; Number of Pins: 2; Case Code (Imperial): 0402; Case Code (Metric): 1005; Size Code: 0402; Min Operating Temperature: -55°C; Max Operating Temperature: 155°C; Tolerance: 1%; Voltage Rating: 50V; Packaging: Tape and Reel; Resistor Type: Thick Film; Termination: SMD/SMT; Features: Moisture Resistant; Series: RC; Number of Terminations: 2; Resistance Tolerance: 1%; Construction: Rectangular; Length: 1mm; Width: 0.5mm; Height: 0.32mm; Depth: 0.5mm; Height - Seated (Max): 0.016inch; RoHS Compliant: Yes; Reach SVHC Compliant: Yes; Military Standard: Not; Lead Free: Lead Free; ComponentLink1URL: https://datasheet.ciiva.com/22661/1686128-22661342.pdf?src-supplier=Element14; ComponentLink1Description: https://datasheet.ciiva.com/22661/1686128-22661342.pdf?src-supplier=Element14; ComponentLink2URL: https://datasheet.ciiva.com/7850/1018594-7850022.pdf?src-supplier=Element14; ComponentLink2Description: https://datasheet.ciiva.com/7850/1018594-7850022.pdf?src-supplier=Element14; ComponentLink3URL: https://datasheet.ciiva.com/7850/1018594-7850023.pdf?src-supplier=Element14; ComponentLink3Description: https://datasheet.ciiva.com/7850/1018594-7850023.pdf?src-supplier=Element14; ComponentLink4URL: https://datasheet.ciiva.com/15215/getdatasheetpartid-328119-15215035.pdf?src-supplier=Verical; ComponentLink4Description: https://datasheet.ciiva.com/15215/getdatasheetpartid-328119-15215035.pdf?src-supplier=Verical; Supplier Part Number 1: RC0402FR-074K7L; LCSC Part Number: C105871
R6 = RC0603FR-07470RL: RES 470 OHM 1% 1/10W 0603; Manufacturer: Yageo; Power Rating: 100mW; Voltage Rating: 50V; Temperature Coefficient: 100ppm/°C; Working Voltage: 75V; Supplier 1: Digi-Key; Manufacturer Part Number: RC0603FR-07470RL; RoHS: Yes; Category: Chip SMD Resistors; Stock 1: 154083; Pricing 1: 1=0.10000, 10=0.02400, 100=0.00970, 1000=0.00436, 2500=0.00378 (USD); Case/Package: 0603; Case Code (Metric): 1608; Case Code (Imperial): 0603; Min Operating Temperature: -55°C; Max Operating Temperature: 155°C; Tolerance: 1%; Resistance: 470R; Packaging: Tape and Reel; Package Quantity: 1; Resistor Type: Thick Film; Number of Terminations: 2; Termination: SMD/SMT; Max Power Dissipation: 100mW; Features: Moisture Resistant; Series: RC; Technology: THICK FILM; Resistance Tolerance: 1%; Construction: Rectangular; Length: 1.6mm; Width: 0.031inch; Height: 0.022inch; Depth: 0.8mm; RoHS Compliant: Yes; REACH SVHC: No SVHC; Military Standard: Not; Lead Free: Lead Free; ComponentLink1URL: https://datasheet.ciiva.com/11808/0900766b80f96399-11808177.pdf?src-supplier=RSComponents; ComponentLink1Description: https://datasheet.ciiva.com/11808/0900766b80f96399-11808177.pdf?src-supplier=RSComponents; ComponentLink2URL: https://datasheet.ciiva.com/7746/1738695-7746359.pdf?src-supplier=Element14; ComponentLink2Description: https://datasheet.ciiva.com/7746/1738695-7746359.pdf?src-supplier=Element14; ComponentLink3URL: https://datasheet.ciiva.com/7746/1738695-7746360.pdf?src-supplier=Element14; ComponentLink3Description: https://datasheet.ciiva.com/7746/1738695-7746360.pdf?src-supplier=Element14; ComponentLink4URL: https://datasheet.ciiva.com/7660/1868787-7660793.pdf?src-supplier=Element14; ComponentLink4Description: https://datasheet.ciiva.com/7660/1868787-7660793.pdf?src-supplier=Element14; ComponentLink5URL: https://datasheet.ciiva.com/46440/1868787-46440907.pdf?src-supplier=Element14; ComponentLink5Description: https://datasheet.ciiva.com/46440/1868787-46440907.pdf?src-supplier=Element14; ComponentLink6URL: https://datasheet.ciiva.com/2454/pyu-r-int-thick-7-2454012.pdf?src-supplier=Digi-Key; ComponentLink6Description: https://datasheet.ciiva.com/2454/pyu-r-int-thick-7-2454012.pdf?src-supplier=Digi-Key; ComponentLink7URL: https://datasheet.ciiva.com/2454/pyu-r-int-thick-7-2454013.pdf?src-supplier=Digi-Key; ComponentLink7Description: https://datasheet.ciiva.com/2454/pyu-r-int-thick-7-2454013.pdf?src-supplier=Digi-Key; ComponentLink8URL: https://datasheet.ciiva.com/2454/pyu-r-int-thick-7-2454014.pdf?src-supplier=Digi-Key; ComponentLink8Description: https://datasheet.ciiva.com/2454/pyu-r-int-thick-7-2454014.pdf?src-supplier=Digi-Key; Supplier Part Number 1: 311-470HRCT-ND; LCSC Part Number: C114669
SW1 = TS-1187A-B-A-B: None Without bracket 50mA 5.1mm 100000 Times 160gf 12V 5.1mm 1.5mm Round Button Standing paste SPST SMD Tactile Switches ROHS; Manufacturer: XKB; Item Type: Switch; Manufacturer Part Number: TS-1187A-B-A-B; Footprint: Custom; LCSC Part Number: C318884; ComponentLink1Description: LCSC; ComponentLink1URL: https://www.lcsc.com/product-detail/Tactile-Switches_XKB-Connection-TS-1187A-B-A-B_C318884.html?s_z=n_C318884
TP1-TP4 = TEST POINT 0.5mm Dia: Test Point ON; Item Type: Test Point; Manufacturer Part Number: TEST POINT 0.5mm Dia
U1 = NRF52832-QFAA-R: IC RF TXRX+MCU BLE 48QFN; Manufacturer: Nordic Semiconductor; Supplier: Arrow Electronics; LCSC Part Number: C77540; Manufacturer Part Number: NRF52832-QFAA-R; RoHS: Yes; Item Type: IC; Stock: 141000; Pricing: 3000=2.746 (USD); ComponentLink1URL: http://www.mouser.com/ds/2/297/nRF52832%20Product%20Brief%20v1.2-890472.pdf?src-supplier=Mouser; ComponentLink1Description: http://www.mouser.com/ds/2/297/nRF52832%20Product%20Brief%20v1.2-890472.pdf?src-supplier=Mouser; ComponentLink2URL: http://infocenter.nordicsemi.com/pdf/nRF52832_PB_v1.7.pdf?src-supplier=Digikey; ComponentLink2Description: http://infocenter.nordicsemi.com/pdf/nRF52832_PB_v1.7.pdf?src-supplier=Digikey; ComponentLink3URL: http://infocenter.nordicsemi.com/pdf/nRF52832_PS_v1.4.pdf?src-supplier=Digikey; ComponentLink3Description: http://infocenter.nordicsemi.com/pdf/nRF52832_PS_v1.4.pdf?src-supplier=Digikey; ComponentLink4URL: https://datasheet.octopart.com/NRF52832-QFAA-R-Nordic-Semiconductor-datasheet-104421228.pdf?src-supplier=LKR; ComponentLink4Description: https://datasheet.octopart.com/NRF52832-QFAA-R-Nordic-Semiconductor-datasheet-104421228.pdf?src-supplier=LKR
U2 = LIS2DW12TR: ACCEL 2-16G I2C/SPI 12LGA; Manufacturer: STMicroelectronics; Output Type: SPI,I2C; Axis: X, Y, Z; Bandwidth: 400Hz; Item Type: IC; Supplier: Mouser; Supplier Part Number: 511-LIS2DW12TR; Manufacturer Part Number: LIS2DW12TR; RoHS: Yes; Category: Accelerometers; Stock: 14817; Pricing: 1=2.65, 10=2.16, 50=2.16, 100=1.54, 1000=1.21, 10000=0.988 (USD); Mounting Technology: Surface Mount; Case/Package: LGA; Pins: 12; Min Operating Temperature: -40°C; Max Operating Temperature: 85°C; Packaging: Cut Tape; Series: -; RoHS Compliant: Yes; ComponentLink1URL: http://www.farnell.com/datasheets/2581666.pdf?src-supplier=Farnell; ComponentLink1Description: http://www.farnell.com/datasheets/2581666.pdf?src-supplier=Farnell; LCSC Part Number: C189624
X1 = Q13FC13500004: 32.768kHz Surface Mount Crystal 12.5pF ±20ppm SMD3215-2P Crystals ROHS; Manufacturer: Epson; Supplier: Farnell; LCSC Part Number: C32346; Manufacturer Part Number: Q13FC13500004; RoHS: Yes; Item Type: Crystals; Stock: 52665; Reach SVHC Compliant: 4187SVHC; ComponentLink1URL: https://datasheet.octopart.com/Q13FC13500004-Epson-datasheet-62043850.pdf?src-supplier=Farnell; ComponentLink1Description: https://datasheet.octopart.com/Q13FC13500004-Epson-datasheet-62043850.pdf?src-supplier=Farnell; ComponentLink2URL: https://datasheet.octopart.com/Q13FC13500004-Epson-datasheet-32025749.pdf?src-supplier=Newark; ComponentLink2Description: https://datasheet.octopart.com/Q13FC13500004-Epson-datasheet-32025749.pdf?src-supplier=Newark
X2 = TAXM32M4ZFBCCT2T: 32MHz Surface Mount Crystal 12pF ±10ppm ±10ppm SMD2016-4P Crystals ROHS; Manufacturer: Yajingxin; Manufacturer Part Number: TAXM32M4ZFBCCT2T; Package: SMD2016-4P; LCSC Part Number: C388797; Item Type: Crystal; ComponentLink1Description: LCSC; ComponentLink1URL: https://www.lcsc.com/product-detail/Crystals_Yajingxin-TAXM32M4ZFBCCT2T_C388797.html?s_z=n_C388797